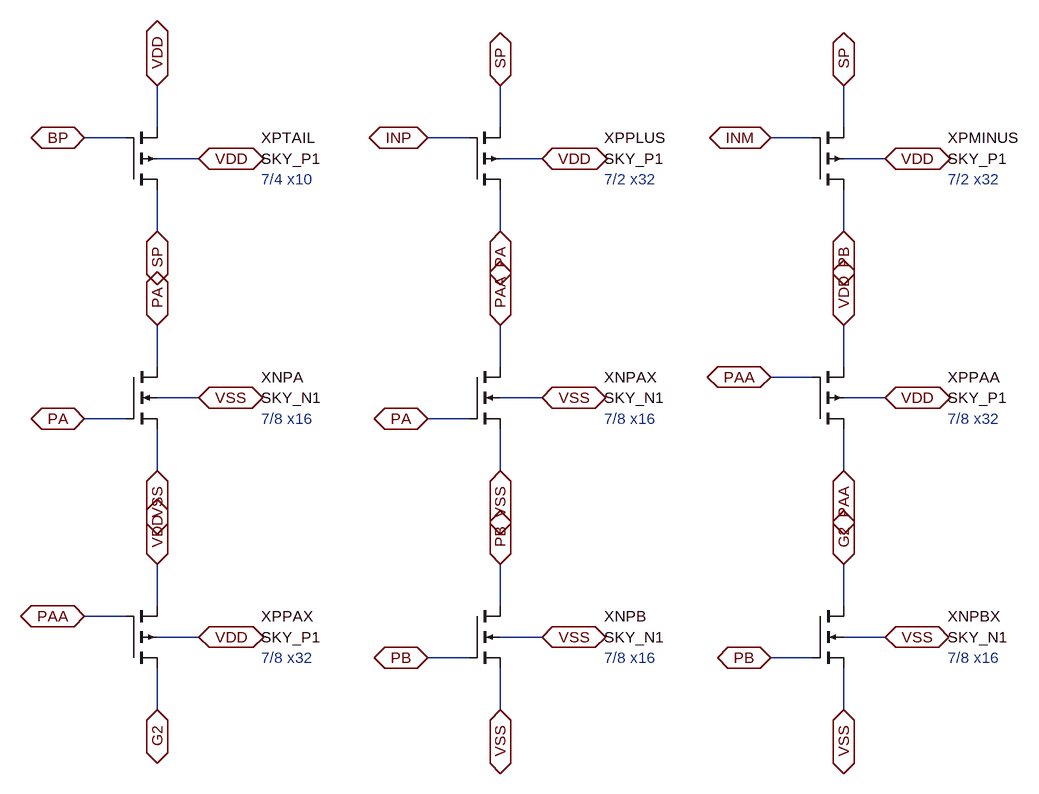
[diagram p0: schematic Sky_InputP.asc]
Sky_InputP.asc, the LTspice schematic file:
Version 4.1
SHEET 1 1728 1408
WIRE 208 256 208 320
WIRE 160 176 96 176
WIRE 208 160 208 96
WIRE 208 208 272 208
WIRE 736 256 736 320
WIRE 688 176 624 176
WIRE 736 160 736 96
WIRE 736 208 800 208
WIRE 1264 256 1264 320
WIRE 1216 176 1152 176
WIRE 1264 160 1264 96
WIRE 1264 208 1328 208
WIRE 208 528 208 464
WIRE 160 608 96 608
WIRE 208 624 208 688
WIRE 208 576 272 576
WIRE 736 528 736 464
WIRE 688 608 624 608
WIRE 736 624 736 688
WIRE 736 576 800 576
WIRE 1264 624 1264 688
WIRE 1216 544 1152 544
WIRE 1264 528 1264 464
WIRE 1264 576 1328 576
WIRE 208 992 208 1056
WIRE 160 912 96 912
WIRE 208 896 208 832
WIRE 208 944 272 944
WIRE 736 896 736 832
WIRE 688 976 624 976
WIRE 736 992 736 1056
WIRE 736 944 800 944
WIRE 1264 896 1264 832
WIRE 1216 976 1152 976
WIRE 1264 992 1264 1056
WIRE 1264 944 1328 944
FLAG 208 320 SP
IOPIN 208 320 BiDir
FLAG 96 176 BP
IOPIN 96 176 BiDir
FLAG 208 96 VDD
IOPIN 208 96 BiDir
FLAG 272 208 VDD
IOPIN 272 208 BiDir
FLAG 736 320 PA
IOPIN 736 320 BiDir
FLAG 624 176 INP
IOPIN 624 176 BiDir
FLAG 736 96 SP
IOPIN 736 96 BiDir
FLAG 800 208 VDD
IOPIN 800 208 BiDir
FLAG 1264 320 PB
IOPIN 1264 320 BiDir
FLAG 1152 176 INM
IOPIN 1152 176 BiDir
FLAG 1264 96 SP
IOPIN 1264 96 BiDir
FLAG 1328 208 VDD
IOPIN 1328 208 BiDir
FLAG 208 464 PA
IOPIN 208 464 BiDir
FLAG 96 608 PA
IOPIN 96 608 BiDir
FLAG 208 688 VSS
IOPIN 208 688 BiDir
FLAG 272 576 VSS
IOPIN 272 576 BiDir
FLAG 736 464 PAA
IOPIN 736 464 BiDir
FLAG 624 608 PA
IOPIN 624 608 BiDir
FLAG 736 688 VSS
IOPIN 736 688 BiDir
FLAG 800 576 VSS
IOPIN 800 576 BiDir
FLAG 1264 688 PAA
IOPIN 1264 688 BiDir
FLAG 1152 544 PAA
IOPIN 1152 544 BiDir
FLAG 1264 464 VDD
IOPIN 1264 464 BiDir
FLAG 1328 576 VDD
IOPIN 1328 576 BiDir
FLAG 208 1056 G2
IOPIN 208 1056 BiDir
FLAG 96 912 PAA
IOPIN 96 912 BiDir
FLAG 208 832 VDD
IOPIN 208 832 BiDir
FLAG 272 944 VDD
IOPIN 272 944 BiDir
FLAG 736 832 PB
IOPIN 736 832 BiDir
FLAG 624 976 PB
IOPIN 624 976 BiDir
FLAG 736 1056 VSS
IOPIN 736 1056 BiDir
FLAG 800 944 VSS
IOPIN 800 944 BiDir
FLAG 1264 832 G2
IOPIN 1264 832 BiDir
FLAG 1152 976 PB
IOPIN 1152 976 BiDir
FLAG 1264 1056 VSS
IOPIN 1264 1056 BiDir
FLAG 1328 944 VSS
IOPIN 1328 944 BiDir
SYMBOL pmos4 160 256 M180
WINDOW 0 208 80 Left 2
WINDOW 3 208 48 Left 2
SYMATTR InstName XPTAIL
SYMATTR Value SKY_P1
SYMATTR SpiceLine w=7 l=4 mult=10
SYMATTR Prefix X
SYMBOL pmos4 688 256 M180
WINDOW 0 208 80 Left 2
WINDOW 3 208 48 Left 2
SYMATTR InstName XPPLUS
SYMATTR Value SKY_P1
SYMATTR SpiceLine w=7 l=2 mult=32
SYMATTR Prefix X
SYMBOL pmos4 1216 256 M180
WINDOW 0 208 80 Left 2
WINDOW 3 208 48 Left 2
SYMATTR InstName XPMINUS
SYMATTR Value SKY_P1
SYMATTR SpiceLine w=7 l=2 mult=32
SYMATTR Prefix X
SYMBOL nmos4 160 528 R0
WINDOW 0 208 16 Left 2
WINDOW 3 208 48 Left 2
SYMATTR InstName XNPA
SYMATTR Value SKY_N1
SYMATTR SpiceLine w=7 l=8 mult=16
SYMATTR Prefix X
SYMBOL nmos4 688 528 R0
WINDOW 0 208 16 Left 2
WINDOW 3 208 48 Left 2
SYMATTR InstName XNPAX
SYMATTR Value SKY_N1
SYMATTR SpiceLine w=7 l=8 mult=16
SYMATTR Prefix X
SYMBOL pmos4 1216 624 M180
WINDOW 0 208 80 Left 2
WINDOW 3 208 48 Left 2
SYMATTR InstName XPPAA
SYMATTR Value SKY_P1
SYMATTR SpiceLine w=7 l=8 mult=32
SYMATTR Prefix X
SYMBOL pmos4 160 992 M180
WINDOW 0 208 80 Left 2
WINDOW 3 208 48 Left 2
SYMATTR InstName XPPAX
SYMATTR Value SKY_P1
SYMATTR SpiceLine w=7 l=8 mult=32
SYMATTR Prefix X
SYMBOL nmos4 688 896 R0
WINDOW 0 208 16 Left 2
WINDOW 3 208 48 Left 2
SYMATTR InstName XNPB
SYMATTR Value SKY_N1
SYMATTR SpiceLine w=7 l=8 mult=16
SYMATTR Prefix X
SYMBOL nmos4 1216 896 R0
WINDOW 0 208 16 Left 2
WINDOW 3 208 48 Left 2
SYMATTR InstName XNPBX
SYMATTR Value SKY_N1
SYMATTR SpiceLine w=7 l=8 mult=16
SYMATTR Prefix X
TEXT 368 240 Left 2 ;7/4 x10
TEXT 896 240 Left 2 ;7/2 x32
TEXT 1424 240 Left 2 ;7/2 x32
TEXT 368 608 Left 2 ;7/8 x16
TEXT 896 608 Left 2 ;7/8 x16
TEXT 1424 608 Left 2 ;7/8 x32
TEXT 368 976 Left 2 ;7/8 x32
TEXT 896 976 Left 2 ;7/8 x16
TEXT 1424 976 Left 2 ;7/8 x16

The netlist it stands for:
* Sky_InputP.asc
X§XPTAIL SP BP VDD VDD SKY_P1 w=7 l=4 mult=10  ; pins D G S B
X§XPPLUS PA INP SP VDD SKY_P1 w=7 l=2 mult=32  ; pins D G S B
X§XPMINUS PB INM SP VDD SKY_P1 w=7 l=2 mult=32  ; pins D G S B
X§XNPA PA PA VSS VSS SKY_N1 w=7 l=8 mult=16  ; pins D G S B
X§XNPAX PAA PA VSS VSS SKY_N1 w=7 l=8 mult=16  ; pins D G S B
X§XPPAA PAA PAA VDD VDD SKY_P1 w=7 l=8 mult=32  ; pins D G S B
X§XPPAX G2 PAA VDD VDD SKY_P1 w=7 l=8 mult=32  ; pins D G S B
X§XNPB PB PB VSS VSS SKY_N1 w=7 l=8 mult=16  ; pins D G S B
X§XNPBX G2 PB VSS VSS SKY_N1 w=7 l=8 mult=16  ; pins D G S B
* 7/4 x10
* 7/2 x32
* 7/2 x32
* 7/8 x16
* 7/8 x16
* 7/8 x32
* 7/8 x32
* 7/8 x16
* 7/8 x16
.backanno
.end